# Altium project Radio_Acquisition_V1.PrjPcb
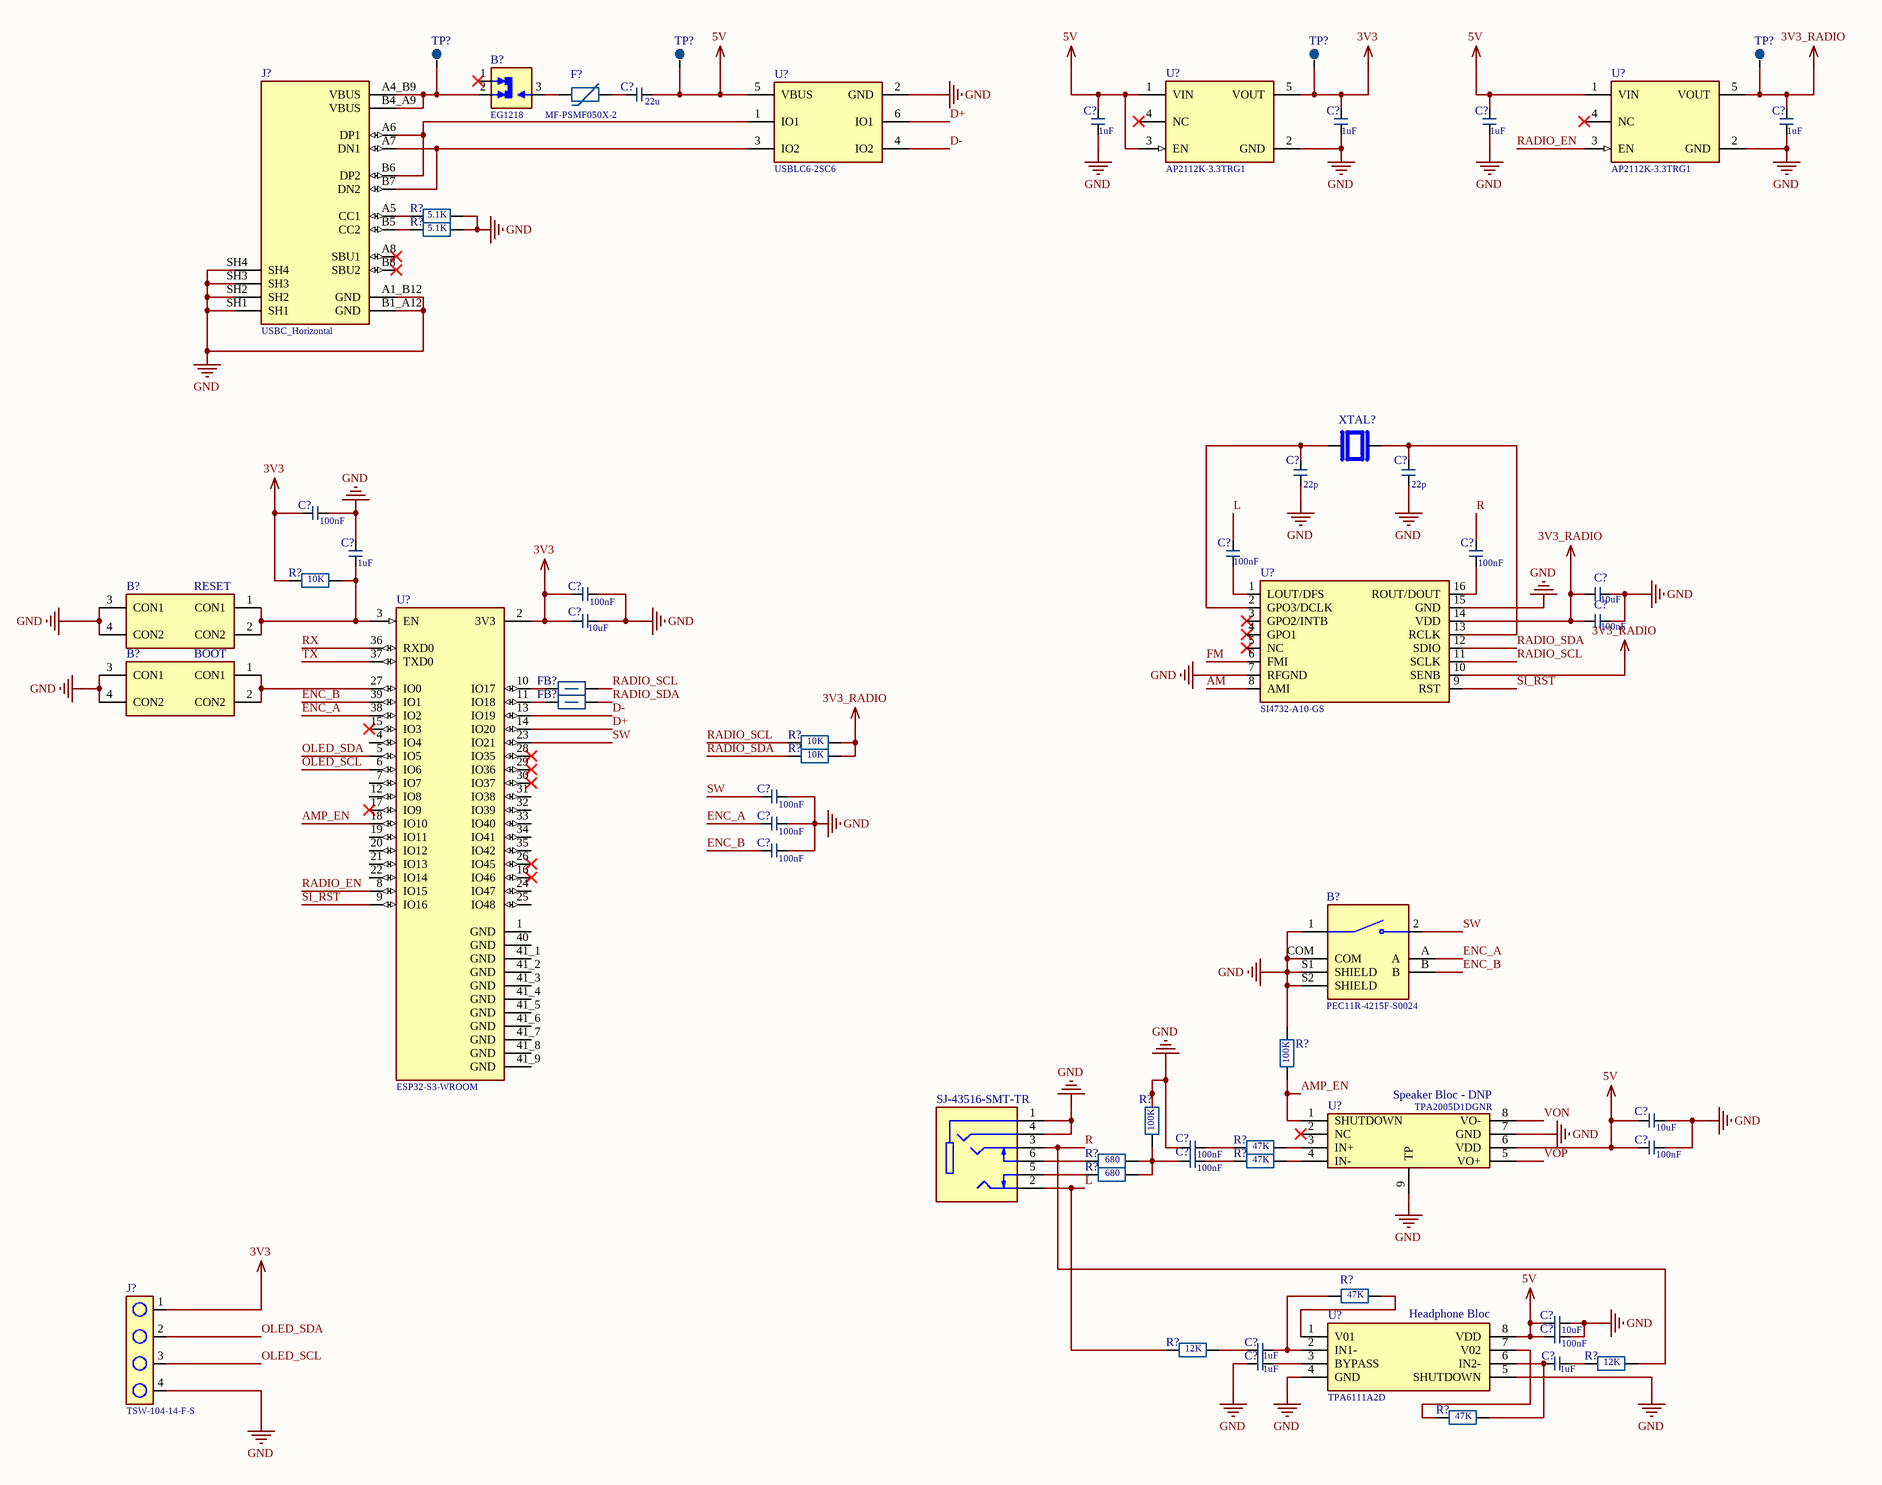
[diagram p0: Sheet1.SchDoc]
1 sheet, 64 parts. Net scope: global (net labels, ports and power ports of the same name join across sheets).

## Sheet Sheet1.SchDoc
size A2; SheetNumber: 1; SheetTotal: 1

### Parts
(Parts that share a designator on the sheet are numbered #1, #2 ... from top to bottom, then left to right.)
B?#1  EG1218  [EG1218]
B?#2  TS18-5-15-SL-260-SMT-TR  [TS18-5-15-SL-260-SMT-TR]  (value not drawn)
B?#3  TS18-5-15-SL-260-SMT-TR  [TS18-5-15-SL-260-SMT-TR]  (value not drawn)
B?#4  PEC11R-4215F-S0024
C?#1  22u  [CAP_0603]
C?#2  1uF  [CAP_0603]
C?#3  1uF  [CAP_0603]
C?#4  1uF  [CAP_0603]
C?#5  1uF  [CAP_0603]
C?#6  22p  [CAP_0603]
C?#7  22p  [CAP_0603]
C?#8  100nF  [CAP_0402]
C?#9  1uF  [CAP_0603]
C?#10  100nF  [CAP_0402]
C?#11  100nF  [CAP_0402]
C?#12  100nF  [CAP_0402]
C?#13  10uF  [CAP_0603]
C?#14  10uF  [CAP_0603]
C?#15  100nF  [CAP_0603]
C?#16  100nF  [CAP_0402]
C?#17  100nF  [CAP_0402]
C?#18  100nF  [CAP_0402]
C?#19  10uF  [CAP_0603]
C?#20  100nF  [CAP_0603]
C?#21  100nF  [CAP_0603]
C?#22  100nF  [CAP_0603]
C?#23  10uF  [CAP_0603]
C?#24  100nF  [CAP_0603]
C?#25  1uF  [CAP_0603]
C?#26  1uF  [CAP_0603]
C?#27  1uF  [CAP_0603]
F?  MF-PSMF050X-2  [MF-PSMF050X]
FB?#1  BLM18KG601BH1D  [FB_0603]  (value not drawn)
FB?#2  BLM18KG601BH1D  [FB_0603]  (value not drawn)
J?#1  USBC_Horizontal  [USBC_Horizontal]
J?#2  TSW-104-14-F-S  [TSW-104-14-F-S]
R?#1  5.1K  [RES_0603]
R?#2  5.1K  [RES_0603]
R?#3  10K  [RES_0603]
R?#4  10K  [RES_0603]
R?#5  10K  [RES_0603]
R?#6  100K  [RES_0603]
R?#7  100K  [RES_0603]
R?#8  47K  [RES_0603]
R?#9  680  [RES_0603]
R?#10  47K  [RES_0603]
R?#11  680  [RES_0603]
R?#12  47K  [RES_0603]
R?#13  12K  [RES_0603]
R?#14  12K  [RES_0603]
R?#15  47K  [RES_0603]
SJ-43516-SMT-TR  SJ-43516-SMT-TR  (value not drawn)
TP?#1  TestPoint_0.4mm  [TestPoint_0.4mm_SMD]  (value not drawn)  (no BOM)
TP?#2  TestPoint_0.4mm  [TestPoint_0.4mm_SMD]  (value not drawn)  (no BOM)
TP?#3  TestPoint_0.4mm  [TestPoint_0.4mm_SMD]  (value not drawn)  (no BOM)
TP?#4  TestPoint_0.4mm  [TestPoint_0.4mm_SMD]  (value not drawn)  (no BOM)
U?#1  USBLC6-2SC6  [USBLC6-2SC6]
U?#2  AP2112K-3.3TRG1  [AP2112K-3.3TRG1]
U?#3  AP2112K-3.3TRG1  [AP2112K-3.3TRG1]
U?#4  SI4732-A10-GS  [SI4732-A10-GS]
U?#5  ESP32-S3-WROOM  [ESP32-S3-WROOM-1-N8R8]
U?#6  TPA2005D1DGNR  [TPA2005D1DGNR]
U?#7  TPA6111A2D  [TPA6111A2D]
XTAL?  ABS07-32.768KHZ-T  [ABS07-32.768KHZ-T]  (value not drawn)

### Nets
3V3: C?#3.2 C?#8.2 C?#12.2 C?#14.1 J?#2.1 R?#3.1 TP?#3.1 U?#2.5(VOUT) U?#5.2(3V3)
3V3_RADIO: C?#5.2 C?#13.2 C?#15.2 R?#4.2 R?#5.2 TP?#4.1 U?#3.5(VOUT) U?#4.10(SENB) U?#4.14(VDD)
5V: C?#1.2 C?#2.2 C?#4.2 C?#19.1 C?#21.1 C?#23.1 C?#24.1 TP?#2.1 U?#1.5(VBUS) U?#2.1(VIN) U?#2.3(EN) U?#3.1(VIN) U?#6.6(VDD) U?#7.8(VDD)
GND: B?#2.3(CON1) B?#2.4(CON2) B?#3.3(CON1) B?#3.4(CON2) B?#4.1 B?#4.COM B?#4.S1(SHIELD) B?#4.S2(SHIELD) C?#2.1 C?#3.1 C?#4.1 C?#5.1 C?#6.1 C?#7.1 C?#8.1 C?#9.2 C?#12.1 C?#13.1 C?#14.2 C?#15.1 C?#16.1 C?#17.1 C?#18.1 C?#19.2 C?#20.1 C?#21.2 C?#23.2 C?#24.2 C?#26.1 J?#1.A1_B12(GND) J?#1.B1_A12(GND) J?#1.SH1 J?#1.SH2 J?#1.SH3 J?#1.SH4 J?#2.4 R?#1.2 R?#2.2 R?#6.2 R?#7.2 SJ-43516-SMT-TR.1 SJ-43516-SMT-TR.4 U?#1.2(GND) U?#2.2(GND) U?#3.2(GND) U?#4.7(RFGND) U?#4.15(GND) U?#6.7(GND) U?#6.9(TP) U?#7.4(GND) U?#7.5(SHUTDOWN)
AM: U?#4.8(AMI)
AMP_EN: R?#6.1 U?#5.18(IO10) U?#6.1(SHUTDOWN)
D+: U?#1.6(IO1) U?#5.14(IO20)
D-: U?#1.4(IO2) U?#5.13(IO19)
ENC_A: B?#4.A C?#17.2 U?#5.38(IO2)
ENC_B: B?#4.B C?#18.2 U?#5.39(IO1)
FM: U?#4.6(FMI)
L: C?#10.2 R?#13.1 SJ-43516-SMT-TR.2
OLED_SCL: J?#2.3 U?#5.6(IO6)
OLED_SDA: J?#2.2 U?#5.5(IO5)
R: C?#11.2 R?#14.2 SJ-43516-SMT-TR.3
RADIO_EN: U?#3.3(EN) U?#5.8(IO15)
RADIO_SCL: FB?#1.2 R?#4.1 U?#4.11(SCLK)
RADIO_SDA: FB?#2.2 R?#5.1 U?#4.12(SDIO)
RX: U?#5.36(RXD0)
SI_RST: U?#4.9(RST) U?#5.9(IO16)
SW: B?#4.2 C?#16.2 U?#5.23(IO21)
TX: U?#5.37(TXD0)
VON: U?#6.8(VO-)
VOP: U?#6.5(VO+)
NetB?#1_2: B?#1.2(COM) J?#1.A4_B9(VBUS) J?#1.B4_A9(VBUS) TP?#1.1
NetB?#1_3: B?#1.3(NO) F?.1
NetB?#2_1: B?#2.1(CON1) B?#2.2(CON2) C?#9.1 R?#3.2 U?#5.3(EN)
NetB?#3_1: B?#3.1(CON1) B?#3.2(CON2) U?#5.27(IO0)
NetC?#1_1: C?#1.1 F?.2
NetC?#6_2: C?#6.2 U?#4.2(GPO3/DCLK) XTAL?.1
NetC?#7_2: C?#7.2 U?#4.13(RCLK) XTAL?.2
NetC?#10_1: C?#10.1 U?#4.1(LOUT/DFS)
NetC?#11_1: C?#11.1 U?#4.16(ROUT/DOUT)
NetC?#20_2: C?#20.2 R?#8.1
NetC?#22_1: C?#22.1 R?#7.1 R?#9.2 R?#11.2
NetC?#22_2: C?#22.2 R?#10.1
NetC?#25_1: C?#25.1 R?#13.2
NetC?#25_2: C?#25.2 R?#12.2 U?#7.2(IN1-)
NetC?#26_2: C?#26.2 U?#7.3(BYPASS)
NetC?#27_1: C?#27.1 R?#15.2 U?#7.6(IN2-)
NetC?#27_2: C?#27.2 R?#14.1
NetFB?#1_1: FB?#1.1 U?#5.10(IO17)
NetFB?#2_1: FB?#2.1 U?#5.11(IO18)
NetJ?#1_A5: J?#1.A5(CC1) R?#1.1
NetJ?#1_A6: J?#1.A6(DP1) J?#1.B6(DP2) U?#1.1(IO1)
NetJ?#1_A7: J?#1.A7(DN1) J?#1.B7(DN2) U?#1.3(IO2)
NetJ?#1_B5: J?#1.B5(CC2) R?#2.1
NetR?#8_2: R?#8.2 U?#6.3(IN+)
NetR?#9_1: R?#9.1 SJ-43516-SMT-TR.6
NetR?#10_2: R?#10.2 U?#6.4(IN-)
NetR?#11_1: R?#11.1 SJ-43516-SMT-TR.5
NetR?#12_1: R?#12.1 U?#7.1(V01)
NetR?#15_1: R?#15.1 U?#7.7(V02)

Not connected (* = marked no-connect by the designer): B?#1 1(NC)*; J?#1 A8(SBU1)* B8(SBU2)*; U?#2 4(NC)*; U?#3 4(NC)*; U?#4 3(GPO2/INTB)* 4(GPO1)* 5(NC)*; U?#5 1(GND) 4(IO4) 7(IO7) 12(IO8) 15(IO3)* 16(IO46)* 17(IO9)* 19(IO11) 20(IO12) 21(IO13) 22(IO14) 24(IO47) 25(IO48) 26(IO45)* 28(IO35)* 29(IO36)* 30(IO37)* 31(IO38) 32(IO39) 33(IO40) 34(IO41) 35(IO42) 40(GND) 41_1(GND) 41_2(GND) 41_3(GND) 41_4(GND) 41_5(GND) 41_6(GND) 41_7(GND) 41_8(GND) 41_9(GND); U?#6 2(NC)*

### Notes on the sheet
- (near B?#2) RESET
- (near B?#2) BOOT
- (near U?#6) Speaker Bloc - DNP
- (near U?#7) Headphone Bloc

### Library data of the parts
B?#1 = EG1218: Slide Switch, SPDT; Manufacturer: E-Switch; Contact Timing: Non-Shorting; Switch Function: On-On; Current Rating: 200 mA DC; Voltage Rating: 30 V DC; Manufacturer Part Number: EG1218; Circuit: SPDT; Supplier 1: Mouser; Supplier Part Number 1: 612-EG1218; Supplier 2: DigiKey; Supplier Part Number 2: EG1903-ND
B?#2 B?#3 = TS18-5-15-SL-260-SMT-TR: Push-button style, NO
B?#4 = PEC11R-4215F-S0024: Rotary Encoder
C?#1 = C_22u_0603: 22 uF 20% 0603 X5R MLCC; Manufacturer: Yageo; Manufacturer Part Number: CC0603MRX5R6BB226; Value: 22 uF; Package (Imperial): 0603; Voltage Rating DC: 10 VDC; Tolerance: 20%; Dielectric: X5R; ComponentLink1Description: Datasheet; ComponentLink1URL: https://yageogroup.com/component-documentation/download/datasheet/CC0603MRX5R6BB226?lang=en; Supplier 1: Mouser; Supplier Part Number 1: 603-CC603MRX5R6BB226; Supplier 2: DigiKey; Supplier Part Number 2: 311-1819-1-ND
C?#2-C?#5 C?#9 C?#25-C?#27 = C_1u_0603: 1 uF 10% 0603 X7R MLCC; Manufacturer: Yageo; Manufacturer Part Number: CC0603KRX7R7BB105; Package (Imperial): 0603; Voltage Rating DC: 16 VDC; Value: 1 uF; Tolerance: 10%; Dielectric: X7R; Datasheet: https://yageogroup.com/component-documentation/download/datasheet/CC0603KRX7R7BB105?lang=en; Supplier 1: Mouser; Supplier Part Number 1: 603-CC603KRX7R7BB105; Supplier 2: DigiKey; Supplier Part Number 2: 311-1446-1-ND
C?#6 C?#7 = C_22p_0603: 22 pF 5% 0603 C0G MLCC; Manufacturer: Yageo; Manufacturer Part Number: CC0603JRNPO9BN220; Value: 22 pF; Package (Imperial): 0603; Voltage Rating DC: 50 VDC; Tolerance: 5%; Dielectric: C0G; ComponentLink1Description: Datasheet; ComponentLink1URL: https://yageogroup.com/component-documentation/download/datasheet/CC0603JRNPO9BN220?lang=en; Supplier 1: Mouser; Supplier Part Number 1: 603-CC603JRNPO9BN220; Supplier 2: DigiKey; Supplier Part Number 2: 311-1062-6-ND
C?#8 C?#10-C?#12 C?#16-C?#18 = C_100n_0402: 100 nF 10% 0402 X7R MLCC; Manufacturer: Yageo; Manufacturer Part Number: CC0402KRX7R9BB104; Package (Imperial): 0402; Voltage Rating DC: 50 VDC; Value: 100 nF; Tolerance: 10%; Dielectric: X7R; Datasheet: https://yageogroup.com/component-documentation/download/datasheet/CC0402KRX7R9BB104?lang=en
C?#13 C?#14 C?#19 C?#23 = C_10u_0805: 10 uF 10% 0805 X7R MLCC; Manufacturer: Yageo; Manufacturer Part Number: C0805C106K8RACTU; Package (Imperial): 0805; Voltage Rating DC: 10 VDC; Value: 10 uF; Tolerance: 10%; Dielectric: X7R; Datasheet: https://yageogroup.com/component-documentation/download/datasheet/C0805C106K8RACTU?lang=en
C?#15 C?#20-C?#22 C?#24 = C_100n_0603: 100 nF 1% 0603 X7R MLCC; Manufacturer: Yageo; Manufacturer Part Number: CC0603KRX7R9BB104; Package (Imperial): 0603; Voltage Rating DC: 50 VDC; Value: 100 nF; Tolerance: 1%; Dielectric: X7R; Datasheet: https://yageogroup.com/component-documentation/download/datasheet/CC0603KRX7R9BB104?lang=en
F? = MF-PSMF050X-2: PPTC 1V 0.5A; Manufacturer: Bourns; Package (Imperial): 0805; Hold Current: 500 mA; Trip Current: 1 A; Maximum Current: 40 A; Maximum Voltage: 6 VDC; Manufacturer Part Number: MF-PSMF050X-2; Termination: Recessed SMD; Supplier 1: Mouser; Supplier Part Number 1: 652-MF-PSMF050X-2; Supplier 2: DigiKey; Supplier Part Number 2: MF-PSMF050X-2CT-ND
FB?#1 FB?#2 = BLM18KG601BH1D: FB 600 Ohm 1 A; Manufacturer: Murata; Package (Imperial): 0603; Value: 600 Ohm; Tolerance: 25%; Maximum DC Current: 1 A; Manufacturer Part Number: BLM18KG601BH1D; Supplier 1: Mouser; Supplier Part Number 1: 81-BLM18KG601BH1D; Supplier 2: DigiKey; Supplier Part Number 2: 490-14032-1-ND
J?#1 = USBC_Horizontal: USB-C, USB-2.0 SMD 16 contacts, horizontal; Manufacturer: GCT; Manufacturer Part Number: USB4105GFA; Number of Contacts: 16; Current Rating: 5 A; Voltage Rating: 48 VDC; Standard: USB-2.0; Termination: SMD; Supplier 1: Mouser; Supplier Part Number 1: 640-USB4105-GF-A
R?#1 R?#2 = R_5.1K_0603: 5.1 kOhm 1% 0603 resistor; Manufacturer: Yageo; Manufacturer Part Number: RC0603FR-075K1L; Package (Imperial): 0603; Power Rating: 0.1 W; Voltage Rating: 75 V; Value: 5.1 kOhm; Tolerance: 1%; ComponentLink1Description: Datasheet; ComponentLink1URL: https://yageogroup.com/content/datasheet/asset/file/PYU-RC_GROUP_51_ROHS_L; Supplier 1: Mouser; Supplier Part Number 1: 603-RC0603FR-075K1L; Supplier 2: DigiKey; Supplier Part Number 2: 311-5.10KHRCT-ND
R?#3-R?#5 = R_10K_0603: 10 kOhm 1% 0603 resistor; Manufacturer: Yageo; Manufacturer Part Number: RC0603FR-0710KL; Value: 10 kOhm; Package (Imperial): 0603; Power Rating: 0.1 W; Voltage Rating: 75 V; Tolerance: 1%; ComponentLink1Description: Datasheet; ComponentLink1URL: https://yageogroup.com/component-documentation/download/datasheet/RC0603FR-0710KL?lang=en
R?#6 R?#7 = R_100K_0603: 100 kOhm 1% 0603 resistor; Manufacturer: Yageo; Manufacturer Part Number: RC0603FR-07100KL; Package (Imperial): 0603; Power Rating: 0.1 W; Voltage Rating: 75 V; Value: 100 kOhm; Tolerance: 1%; ComponentLink1Description: Datasheet; ComponentLink1URL: https://yageogroup.com/component-documentation/download/datasheet/RC0603FR-07100KL?lang=en
R?#8 R?#10 R?#12 R?#15 = R_47K_0603: 47 kOhm 1% 0603 resistor; Manufacturer: Yageo; Manufacturer Part Number: RC0603FR-0747KL; Value: 47 kOhm; Package (Imperial): 0603; Power Rating: 0.1 W; Voltage Rating: 75 V; Tolerance: 1%; ComponentLink1Description: Datasheet; ComponentLink1URL: https://yageogroup.com/component-documentation/download/datasheet/RC0603FR-0747KL?lang=en; Supplier 1: Mouser; Supplier Part Number 1: 603-RC0603FR-0747KL; Supplier 2: DigiKey; Supplier Part Number 2: 311-47.0KHRDKR-ND
R?#9 R?#11 = R_680_0603: 680 Ohm 1% 0603 resistor; Manufacturer: Yageo; Manufacturer Part Number: RC0603FR-07680RL; Package (Imperial): 0603; Power Rating: 0.1 W; Voltage Rating: 75 V; Value: 680; Tolerance: 1%; Supplier 1: Mouser; Supplier Part Number 1: 603-RC0603FR-07680RL; Supplier 2: DigiKey; Supplier Part Number 2: 311-680HRDKR-ND
R?#13 R?#14 = R_12K_0603: 12 kOhm 1% 0603 resistor; Manufacturer: Yageo; Manufacturer Part Number: RC0603FR-0712KL; Value: 12 kOhm; Package (Imperial): 0603; Power Rating: 0.1 W; Voltage Rating: 75 V; Tolerance: 1%; Supplier 1: Mouser; Supplier Part Number 1: 603-RC0603FR-0712KL; Supplier 2: Future Electronics; Supplier Part Number 2: RC0603FR-0712KL; ComponentLink1Description: Datasheet; ComponentLink1URL: https://yageogroup.com/component-documentation/download/datasheet/RC0603FR-0712KL?lang=en
TP?#1-TP?#4 = TestPoint_0.4mm: SMD Testpoint. No component to be bought.
U?#1 = USBLC6-2SC6: Dual-line ESD Surge Protector, 0.6 pF; Manufacturer: STMicroelectronics; Manufacturer Part Number: USBLC6-2SC6; Package: SOT-23-6; Topology: -; Input Voltage: -; Output Voltage: -; Output Current: -; Supplier 1: Mouser; Supplier Part Number 1: 511-USBLC6-2SC6; Supplier 2: DigiKey; Supplier Part Number 2: 497-5235-6-ND
U?#2 U?#3 = AP2112K-3.3TRG1: 600 mA 3.3 V LDO; Manufacturer: Diodes Incorporated; Input Voltage: 5 V; Output Voltage: 3.3 V; Output Current: 600 mA; Manufacturer Part Number: AP2112K-3.3TRG1; Package: SOT-23-5; Topology: LDO; Supplier 1: Mouser; Supplier Part Number 1: 621-AP2112K-3.3TRG1; Supplier 2: DigiKey; Supplier Part Number 2: AP2112K-3.3TRG1DICT-ND
U?#4 = SI4732-A10-GS: RF Receiver; Manufacturer: Silicon Labratories; Topology: Digital Low-IF; Input Voltage: 2.7 V - 3.3 V; Manufacturer Part Search: SI4732-A10-GS; Package: SOIC-16; Output Voltage: -; Output Current: -; ComponentLink1Description: Datasheet; ComponentLink1URL: https://www.skyworksinc.com/-/media/Skyworks/SL/documents/public/data-shorts/Si4732-A10-short.pdf; ComponentLink2Description: Mouser; ComponentLink2URL: https://www.mouser.in/en/ProductDetail/Skyworks-Solutions-Inc/SI4732-A10-GS?qs=p9T7GgSe1IFCUks4Oy6aSA%3D%3D; ComponentLink3Description: DigiKey; ComponentLink3URL: https://www.digikey.in/en/products/detail/skyworks-solutions-inc/si4732-a10-gs/4576679
U?#5 = ESP32-S3-WROOM-1-N8R8: Manufacturer: Espressif; Input Voltage: 3-3.6 V; Operating Voltage: 3.3 V; Manufacturer Part Number: ESP32-S3-WROOM-1-N8R8; Package: SMD Module; Topology: -; Output Voltage: -; Output Current: -; ComponentLink1Description: Datasheet; ComponentLink1URL: https://www.mouser.in/datasheet/3/1574/1/esp32-s3-wroom-1_wroom-1u_datasheet_en.pdf; Supplier 1: Mouser; Supplier Part Number 1: 356-ESP32S3WRM1UN4R8; Supplier 2: DigiKey; Supplier Part Number 2: 1965-ESP32-S3-WROOM-1U-N4R8CT-ND
U?#6 = TPA2005D1DGNR: Class-D Audio Amplifier; Manufacturer: Texas Instruments; Topology: Class-D Amplifier; Input Voltage: 2.5 - 5.5 V; Manufacturer Part Number: TPA2005D1DGNR; Package: HVSSOP; Output Voltage: -; Output Current: -; Supplier 1: Mouser; Supplier Part Number 1: 595-TPA2005D1DGNR; Supplier 2: DigiKey; Supplier Part Number 2: 296-26876-1-ND; ComponentLink1Description: Datasheet; ComponentLink1URL: https://www.ti.com/lit/gpn/tpa2005d1-q1
U?#7 = TPA6111A2D: Audio Amplifier; Manufacturer: Texas Instruments; Manufacturer Part Number: TPA6111A2D; ComponentLink1Description: Datasheet; ComponentLink1URL: https://www.ti.com/lit/gpn/tpa6111a2; Supplier 1: Mouser; Supplier Part Number 1: 595-TPA6111A2D; Supplier 2: DigiKey; Supplier Part Number 2: 296-26887-5-ND